# Altium project 显示屏.PrjPcb
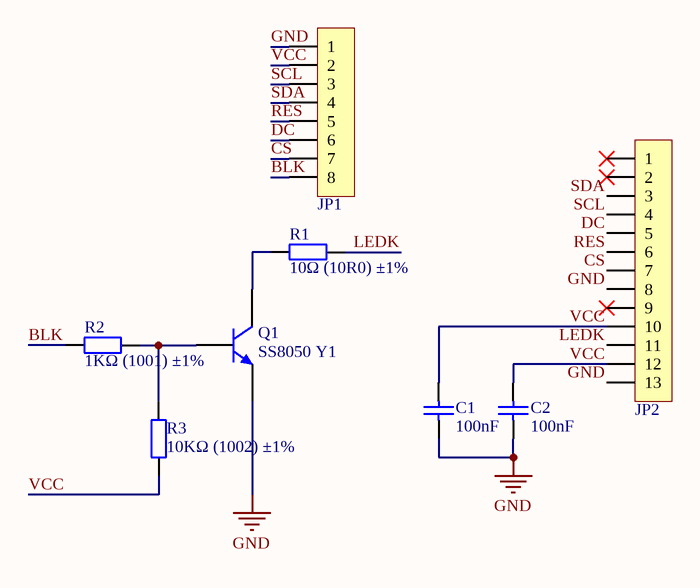
[diagram p0: IPS114转接板.SchDoc]
1 sheet, 8 parts. Net scope: global (net labels, ports and power ports of the same name join across sheets).
Board file: PCB1.PcbDoc

## Sheet IPS114转接板.SchDoc
size A4; SheetNumber: 1; SheetTotal: 1

### Parts
C1  100nF  [0603_C]
C2  100nF  [0603_C]
JP1  HDR-1X8  [HDR2.54-LI-8P]  (value not drawn)
JP2  HDR-1X13  [IPS114]  (value not drawn)
Q1  SS8050 Y1  [SOT-23(SOT-23-3)]
R1  10Ω (10R0) ±1%  [0603_R]
R2  1KΩ (1001) ±1%  [0603_R]
R3  10KΩ (1002) ±1%  [0603_R]

### Nets
GND: C1.1 C2.1 JP1.1 JP2.8 JP2.13 Q1.2(E)
BLK: JP1.8 R2.1
CS: JP1.7 JP2.7
DC: JP1.6 JP2.5
LEDK: JP2.11 R1.2
RES: JP1.5 JP2.6
SCL: JP1.3 JP2.4
SDA: JP1.4 JP2.3
VCC: C1.2 C2.2 JP1.2 JP2.10 JP2.12 R3.1
NetQ1_1: Q1.1(B) R2.2 R3.2
NetQ1_3: Q1.3(C) R1.1

Not connected (* = marked no-connect by the designer): JP2 1* 2* 9*

### Library data of the parts
C1 C2 = 0603 100nF (104) 10% 50V: 贴片电容; ComponentLink1Description: 供应商链接; ComponentLink1URL: http://www.szlcsc.com/product/details_15331.html; Package: 0603; Supplier: LC; SuppliersPartNumber: C14663
JP1 = Header 8: 8P接插件; 版权归属: 源创客; BOM名称: 8P接插件; 学习资源: www.ooocke.com
JP2 = Header 13: 13P接插件; 版权归属: 源创客; BOM名称: 13P接插件; 学习资源: www.ooocke.com
Q1 = SOT-23 SS8050 Y1: 三极管; ComponentLink1Description: 供应商链接; ComponentLink1URL: http://www.szlcsc.com/product/details_2507.html; Package: SOT-23; Supplier: LC; SuppliersPartNumber: C2150
R1 = 0603 10Ω (10R0) 1%: 贴片电阻; ComponentLink1Description: 供应商链接; ComponentLink1URL: http://www.szlcsc.com/product/details_23586.html; Package: 0603; Supplier: LC; SuppliersPartNumber: C22859
R2 = 0603 1KΩ (1001) 1%: 贴片电阻; ComponentLink1Description: 供应商链接; ComponentLink1URL: http://www.szlcsc.com/product/details_21904.html; Package: 0603; Supplier: LC; SuppliersPartNumber: C21190
R3 = 0603 10KΩ (1002) 1%: 贴片电阻; ComponentLink1Description: 供应商链接; ComponentLink1URL: http://www.szlcsc.com/product/details_26547.html; Package: 0603; Supplier: LC; SuppliersPartNumber: C25804